# Altium schematic sheet TOP.SchDoc
size A2; SheetNumber: 1; SheetTotal: 18
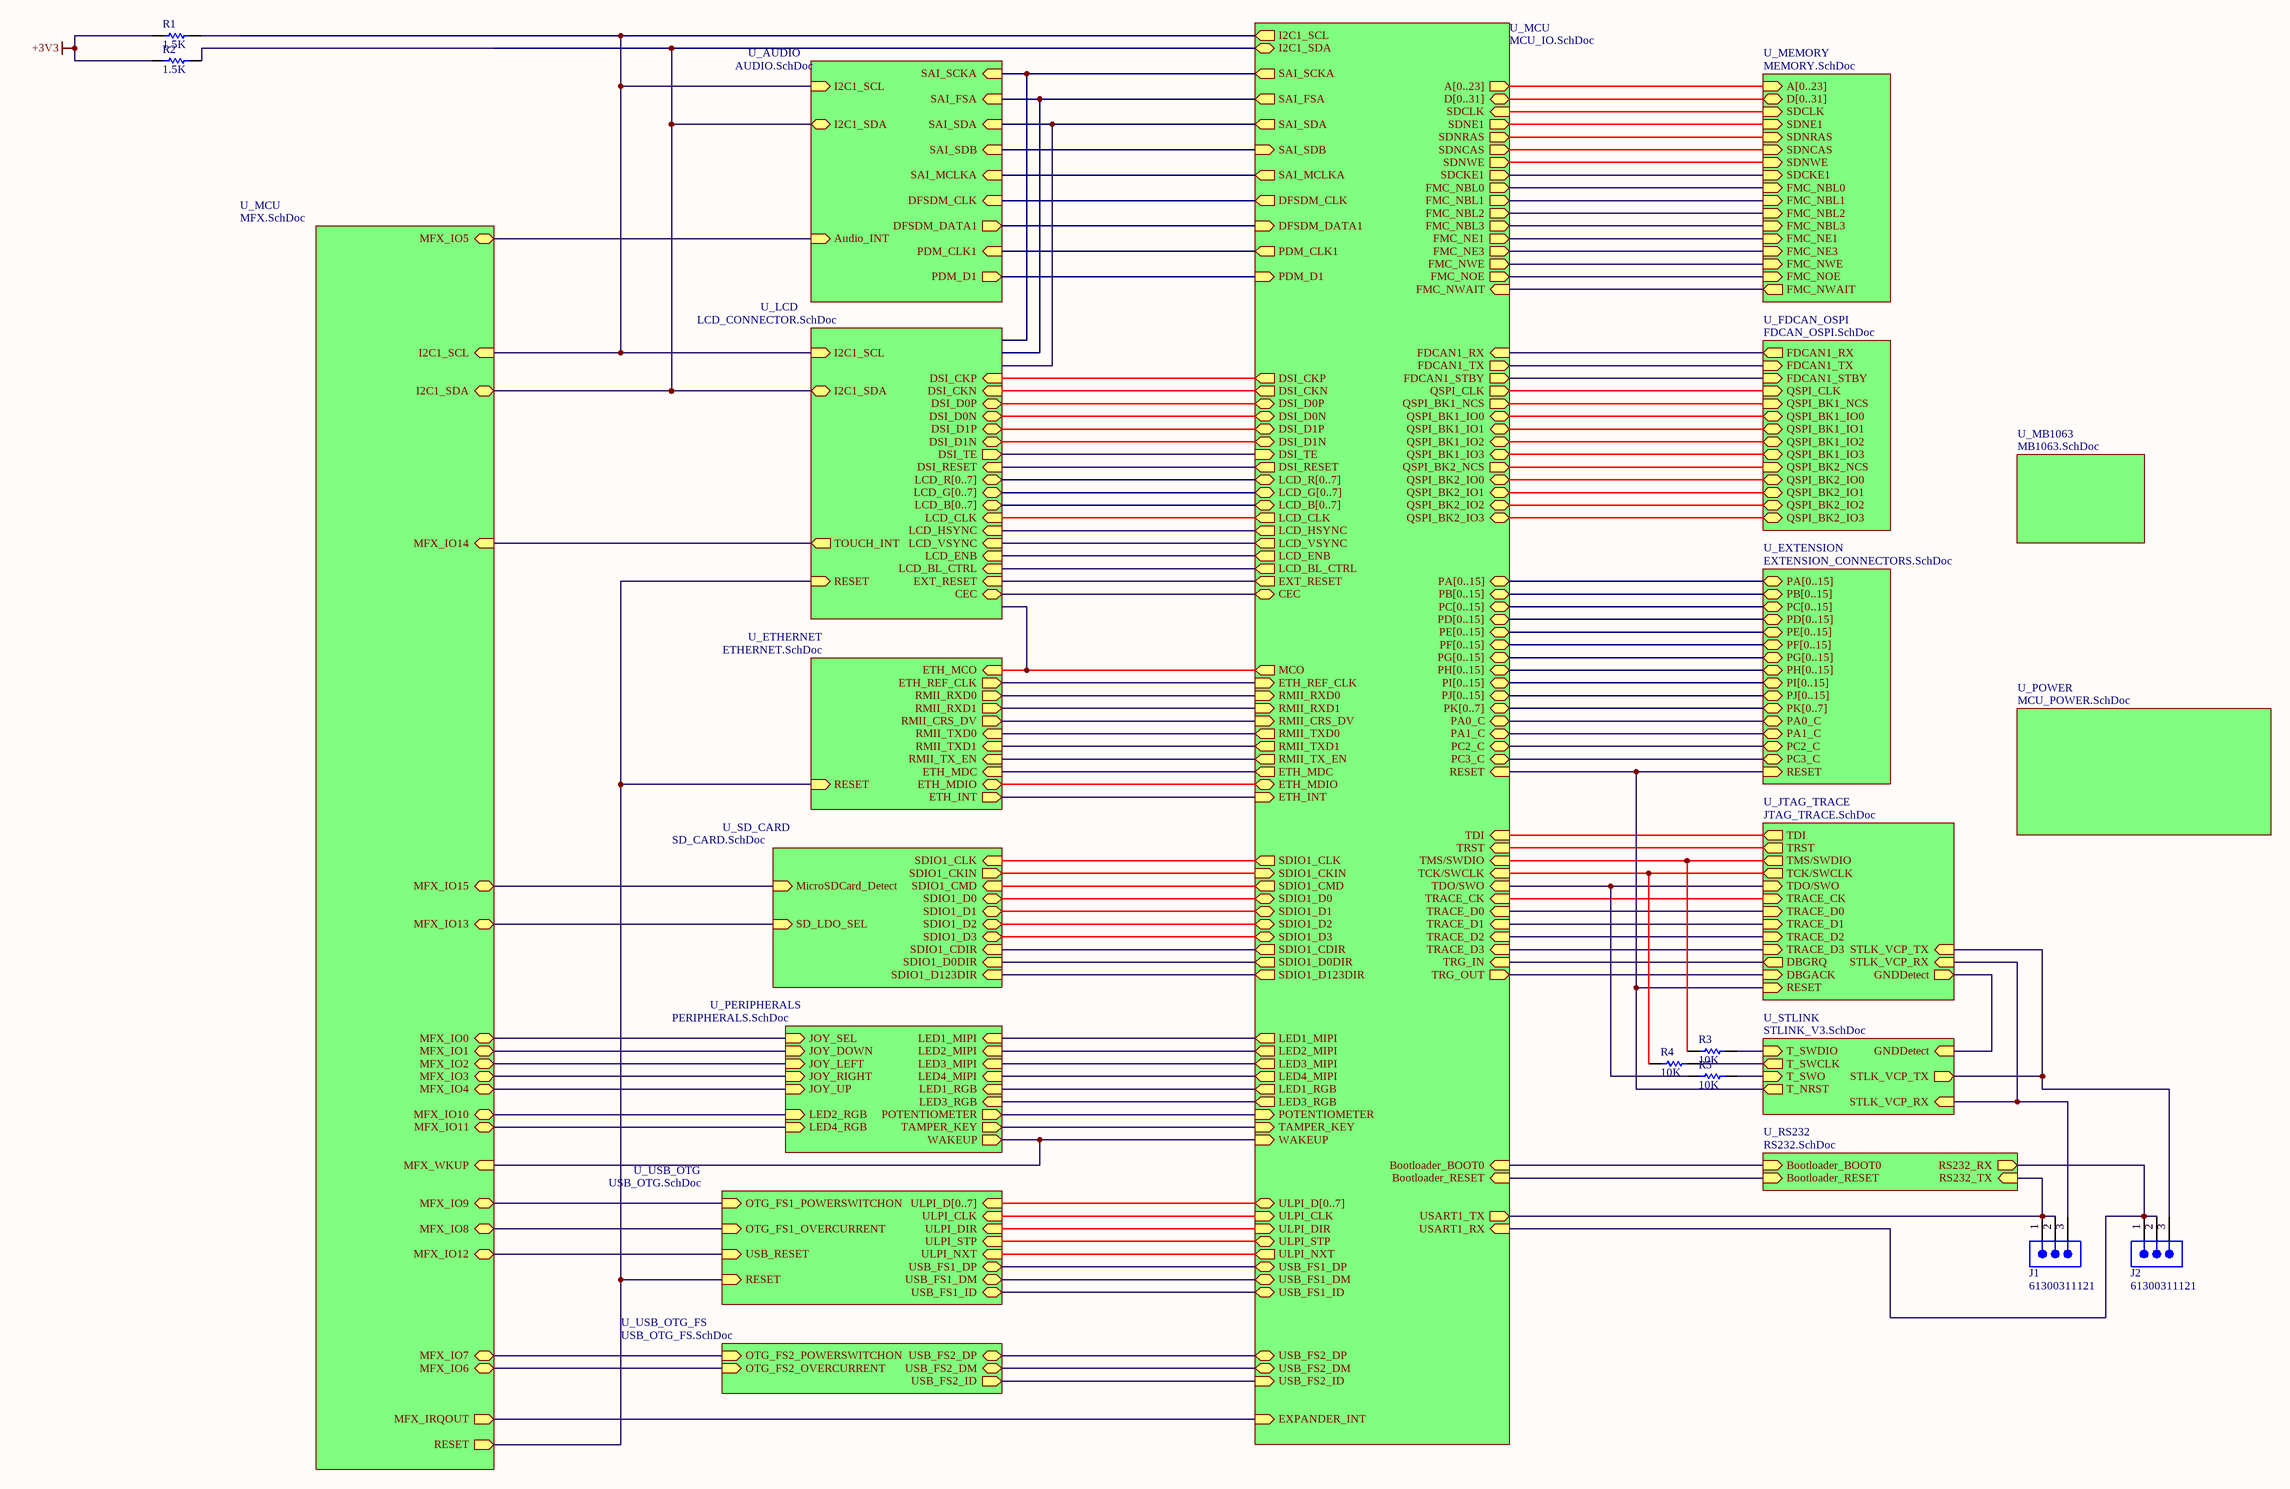
[diagram p0: TOP.SchDoc]

## Parts
J1  61300311121  [61300311121]
J2  61300311121  [61300311121]
R1  1.5K  [RESC1608X55X25NL10T15]
R2  1.5K  [RESC1608X55X25NL10T15]
R3  10K  [RESC1608X55X25NL10T15]
R4  10K  [RESC1608X55X25NL10T15]
R5  10K  [RESC1608X55X25NL10T15]

## Sub-sheets
U_AUDIO = AUDIO.SchDoc: Audio_INT (in), I2C1_SCL (in), I2C1_SDA (bidir), SAI_FSA (in), PDM_D1 (out), PDM_CLK1 (in), DFSDM_DATA1 (out), DFSDM_CLK (in), SAI_MCLKA (in), SAI_SDB (in), SAI_SDA (in), SAI_SCKA (in)
U_ETHERNET = ETHERNET.SchDoc: ETH_MCO (in), ETH_REF_CLK (out), RMII_RXD0 (out), RMII_RXD1 (out), RMII_CRS_DV (out), RMII_TXD1 (in), RMII_TX_EN (in), ETH_MDC (in), ETH_MDIO (bidir), ETH_INT (out), RESET (in), RMII_TXD0 (in)
U_EXTENSION = EXTENSION_CONNECTORS.SchDoc: PA[0..15] (bidir), PB[0..15] (bidir), PC[0..15] (bidir), PD[0..15] (bidir), PE[0..15] (bidir), PF[0..15] (bidir), PG[0..15] (bidir), PH[0..15] (bidir), PI[0..15] (bidir), PJ[0..15] (bidir), PK[0..7] (bidir), PA0_C (bidir), PA1_C (bidir), PC2_C (bidir), PC3_C (bidir), RESET (in)
U_FDCAN_OSPI = FDCAN_OSPI.SchDoc: FDCAN1_RX (out), FDCAN1_TX (in), FDCAN1_STBY (in), QSPI_CLK (in), QSPI_BK1_NCS (in), QSPI_BK1_IO0 (bidir), QSPI_BK1_IO1 (bidir), QSPI_BK1_IO2 (bidir), QSPI_BK1_IO3 (bidir), QSPI_BK2_NCS (in), QSPI_BK2_IO0 (bidir), QSPI_BK2_IO1 (bidir), QSPI_BK2_IO2 (bidir), QSPI_BK2_IO3 (bidir)
U_JTAG_TRACE = JTAG_TRACE.SchDoc: TDI (out), TRST (out), TMS/SWDIO (out), TCK/SWCLK (out), TDO/SWO (in), TRACE_CK (in), TRACE_D0 (in), TRACE_D1 (in), TRACE_D2 (in), TRACE_D3 (in), DBGRQ (out), DBGACK (in), RESET (in), STLK_VCP_TX (in), STLK_VCP_RX (in), GNDDetect (out)
U_LCD = LCD_CONNECTOR.SchDoc: I2C1_SCL (in), I2C1_SDA (bidir), LCD_R[0..7] (bidir), LCD_G[0..7] (bidir), LCD_B[0..7] (bidir), LCD_CLK (in), LCD_HSYNC (in), LCD_VSYNC (in), LCD_ENB (in), EXT_RESET (in), RESET (in), TOUCH_INT (out), LCD_BL_CTRL (in), DSI_CKP (in), DSI_CKN (in), DSI_D0P (bidir), DSI_D0N (bidir), DSI_D1P (bidir), DSI_D1N (bidir), CEC (bidir), DSI_RESET (in), DSI_TE (out)
U_MB1063 = MB1063.SchDoc: no entries
U_MCU = MFX.SchDoc: MFX_IO5 (bidir), I2C1_SCL (in), I2C1_SDA (bidir), MFX_IO14 (in), MFX_IO15 (bidir), MFX_IO13 (bidir), MFX_IO0 (bidir), MFX_IO1 (bidir), MFX_IO2 (bidir), MFX_IO3 (bidir), MFX_IO4 (bidir), MFX_IO10 (bidir), MFX_IO11 (bidir), MFX_WKUP (in), MFX_IO9 (bidir), MFX_IO8 (bidir), MFX_IO12 (bidir), MFX_IO7 (bidir), MFX_IO6 (bidir), MFX_IRQOUT (out), RESET (out)
U_MCU = MCU_IO.SchDoc: SAI_MCLKA (out), PDM_D1 (in), PDM_CLK1 (out), DFSDM_DATA1 (in), DFSDM_CLK (out), I2C1_SCL (out), I2C1_SDA (bidir), SAI_SCKA (out), SAI_FSA (out), SAI_SDA (out), SAI_SDB (in), DSI_CKP (out), DSI_CKN (out), DSI_D0P (bidir), DSI_D0N (bidir), DSI_D1P (bidir), DSI_D1N (bidir), DSI_TE (in), DSI_RESET (out), LCD_R[0..7] (bidir), LCD_G[0..7] (bidir), LCD_B[0..7] (bidir), LCD_CLK (out), LCD_HSYNC (out), LCD_VSYNC (out), LCD_ENB (out), LCD_BL_CTRL (out), EXT_RESET (out), CEC (bidir), MCO (out), ETH_REF_CLK (in), RMII_RXD0 (in), RMII_RXD1 (in), RMII_CRS_DV (in), RMII_TXD1 (out), RMII_TX_EN (out), ETH_MDC (out), ETH_MDIO (bidir), ETH_INT (in), RMII_TXD0 (out), SDIO1_CLK (out), SDIO1_CKIN (in), SDIO1_CMD (out), SDIO1_D0 (bidir), SDIO1_D1 (bidir), SDIO1_D2 (bidir), SDIO1_D3 (bidir), SDIO1_CDIR (out), SDIO1_D0DIR (out), SDIO1_D123DIR (out), LED1_MIPI (out), LED2_MIPI (out), LED3_MIPI (out), LED4_MIPI (out), LED1_RGB (out), LED3_RGB (out), POTENTIOMETER (in), TAMPER_KEY (in), WAKEUP (in), ULPI_D[0..7] (bidir), ULPI_CLK (in), ULPI_DIR (in), ULPI_STP (bidir), ULPI_NXT (out), USB_FS1_DP (bidir), USB_FS1_DM (bidir), USB_FS1_ID (bidir), USB_FS2_DP (bidir), USB_FS2_DM (bidir), USB_FS2_ID (in), EXPANDER_INT (in), A[0..23] (out), D[0..31] (bidir), SDCLK (in), SDNE1 (out), SDNRAS (out), SDNCAS (out), SDNWE (out), SDCKE1 (out), FMC_NBL0 (out), FMC_NBL1 (out), FMC_NBL2 (out), FMC_NBL3 (out), FMC_NE1 (out), FMC_NE3 (out), FMC_NWE (out), FMC_NOE (out), FMC_NWAIT (in), FDCAN1_RX (in), FDCAN1_TX (out), FDCAN1_STBY (out), QSPI_CLK (out), QSPI_BK1_NCS (out), QSPI_BK1_IO0 (bidir), QSPI_BK1_IO1 (bidir), QSPI_BK1_IO2 (bidir), QSPI_BK1_IO3 (bidir), QSPI_BK2_NCS (out), QSPI_BK2_IO0 (bidir), QSPI_BK2_IO1 (bidir), QSPI_BK2_IO2 (bidir), QSPI_BK2_IO3 (bidir), PA[0..15] (bidir), PB[0..15] (bidir), PC[0..15] (bidir), PD[0..15] (bidir), PE[0..15] (bidir), PF[0..15] (bidir), PG[0..15] (bidir), PH[0..15] (bidir), PI[0..15] (bidir), PJ[0..15] (bidir), PK[0..7] (bidir), PA0_C (bidir), PA1_C (bidir), PC2_C (bidir), PC3_C (bidir), RESET (in), TDI (in), TRST (in), TMS/SWDIO (in), TCK/SWCLK (in), TDO/SWO (in), TRACE_CK (in), TRACE_D0 (in), TRACE_D1 (in), TRACE_D2 (in), TRACE_D3 (in), TRG_IN (in), TRG_OUT (out), Bootloader_BOOT0 (in), Bootloader_RESET (in), USART1_TX (out), USART1_RX (in)
U_MEMORY = MEMORY.SchDoc: A[0..23] (in), D[0..31] (bidir), SDCLK (in), SDNE1 (in), SDNRAS (in), SDNCAS (in), SDNWE (in), SDCKE1 (in), FMC_NBL0 (in), FMC_NBL1 (in), FMC_NBL2 (in), FMC_NBL3 (in), FMC_NE1 (in), FMC_NE3 (in), FMC_NWE (in), FMC_NOE (in), FMC_NWAIT (out)
U_PERIPHERALS = PERIPHERALS.SchDoc: JOY_SEL (in), JOY_DOWN (in), JOY_LEFT (in), JOY_RIGHT (in), JOY_UP (in), LED2_RGB (in), LED4_RGB (in), LED1_MIPI (in), LED2_MIPI (in), LED3_MIPI (in), LED4_MIPI (in), LED1_RGB (in), LED3_RGB (in), POTENTIOMETER (out), TAMPER_KEY (out), WAKEUP (out)
U_POWER = MCU_POWER.SchDoc: no entries
U_RS232 = RS232.SchDoc: Bootloader_BOOT0 (in), Bootloader_RESET (in), RS232_RX (out), RS232_TX (in)
U_SD_CARD = SD_CARD.SchDoc: MicroSDCard_Detect (in), SD_LDO_SEL (in), SDIO1_CLK (in), SDIO1_CKIN (out), SDIO1_CMD (in), SDIO1_D0 (bidir), SDIO1_D1 (bidir), SDIO1_D2 (bidir), SDIO1_D3 (bidir), SDIO1_CDIR (in), SDIO1_D0DIR (in), SDIO1_D123DIR (in)
U_STLINK = STLINK_V3.SchDoc: T_SWDIO (in), T_SWCLK (out), T_SWO (in), T_NRST (out), GNDDetect (in), STLK_VCP_TX (out), STLK_VCP_RX (in)
U_USB_OTG = USB_OTG.SchDoc: OTG_FS1_POWERSWITCHON (in), OTG_FS1_OVERCURRENT (in), USB_RESET (in), RESET (in), ULPI_D[0..7] (in), ULPI_CLK (in), ULPI_DIR (in), ULPI_STP (in), ULPI_NXT (in), USB_FS1_DP (bidir), USB_FS1_DM (bidir), USB_FS1_ID (bidir)
U_USB_OTG_FS = USB_OTG_FS.SchDoc: USB_FS2_DP (bidir), USB_FS2_DM (bidir), USB_FS2_ID (out), OTG_FS2_POWERSWITCHON (in), OTG_FS2_OVERCURRENT (in)

## Nets
+3V3: R1.1 R2.1
NetJ1_1: J1.1 J1.2 ; sheet U_MCU/USART1_TX, sheet U_RS232/RS232_TX
NetJ1_3: J1.3 ; sheet U_JTAG_TRACE/STLK_VCP_RX, sheet U_STLINK/STLK_VCP_RX
NetJ2_1: J2.1 J2.2 ; sheet U_MCU/USART1_RX, sheet U_RS232/RS232_RX
NetJ2_3: J2.3 ; sheet U_JTAG_TRACE/STLK_VCP_TX, sheet U_STLINK/STLK_VCP_TX
NetR1_2: R1.2 ; sheet U_MCU/I2C1_SCL, sheet U_MCU/I2C1_SCL, sheet U_AUDIO/I2C1_SCL, sheet U_LCD/I2C1_SCL
NetR2_2: R2.2 ; sheet U_MCU/I2C1_SDA, sheet U_MCU/I2C1_SDA, sheet U_AUDIO/I2C1_SDA, sheet U_LCD/I2C1_SDA
NetR3_1: R3.1 ; sheet U_MCU/TMS/SWDIO, sheet U_JTAG_TRACE/TMS/SWDIO
NetR3_2: R3.2 ; sheet U_STLINK/T_SWDIO
NetR4_1: R4.1 ; sheet U_MCU/TCK/SWCLK, sheet U_JTAG_TRACE/TCK/SWCLK
NetR4_2: R4.2 ; sheet U_STLINK/T_SWCLK
NetR5_1: R5.1 ; sheet U_MCU/TDO/SWO, sheet U_JTAG_TRACE/TDO/SWO
NetR5_2: R5.2 ; sheet U_STLINK/T_SWO
(unnamed): sheet U_MCU/MFX_IO5, sheet U_AUDIO/Audio_INT
(unnamed): sheet U_MCU/MFX_IO14, sheet U_LCD/TOUCH_INT
(unnamed): sheet U_MCU/MFX_IO15, sheet U_SD_CARD/MicroSDCard_Detect
(unnamed): sheet U_MCU/MFX_IO13, sheet U_SD_CARD/SD_LDO_SEL
(unnamed): sheet U_MCU/MFX_IO0, sheet U_PERIPHERALS/JOY_SEL
(unnamed): sheet U_MCU/MFX_IO1, sheet U_PERIPHERALS/JOY_DOWN
(unnamed): sheet U_MCU/MFX_IO2, sheet U_PERIPHERALS/JOY_LEFT
(unnamed): sheet U_MCU/MFX_IO3, sheet U_PERIPHERALS/JOY_RIGHT
(unnamed): sheet U_MCU/MFX_IO4, sheet U_PERIPHERALS/JOY_UP
(unnamed): sheet U_MCU/MFX_IO10, sheet U_PERIPHERALS/LED2_RGB
(unnamed): sheet U_MCU/MFX_IO11, sheet U_PERIPHERALS/LED4_RGB
(unnamed): sheet U_MCU/MFX_WKUP, sheet U_MCU/WAKEUP, sheet U_PERIPHERALS/WAKEUP
(unnamed): sheet U_MCU/MFX_IO9, sheet U_USB_OTG/OTG_FS1_POWERSWITCHON
(unnamed): sheet U_MCU/MFX_IO8, sheet U_USB_OTG/OTG_FS1_OVERCURRENT
(unnamed): sheet U_MCU/MFX_IO12, sheet U_USB_OTG/USB_RESET
(unnamed): sheet U_MCU/MFX_IO7, sheet U_USB_OTG_FS/OTG_FS2_POWERSWITCHON
(unnamed): sheet U_MCU/MFX_IO6, sheet U_USB_OTG_FS/OTG_FS2_OVERCURRENT
(unnamed): sheet U_MCU/MFX_IRQOUT, sheet U_MCU/EXPANDER_INT
(unnamed): sheet U_MCU/RESET, sheet U_LCD/RESET, sheet U_ETHERNET/RESET, sheet U_USB_OTG/RESET
(unnamed): sheet U_MCU/SAI_MCLKA, sheet U_AUDIO/SAI_MCLKA
(unnamed): sheet U_MCU/PDM_D1, sheet U_AUDIO/PDM_D1
(unnamed): sheet U_MCU/PDM_CLK1, sheet U_AUDIO/PDM_CLK1
(unnamed): sheet U_MCU/DFSDM_DATA1, sheet U_AUDIO/DFSDM_DATA1
(unnamed): sheet U_MCU/DFSDM_CLK, sheet U_AUDIO/DFSDM_CLK
(unnamed): sheet U_MCU/SAI_SCKA, sheet U_AUDIO/SAI_SCKA
(unnamed): sheet U_MCU/SAI_FSA, sheet U_AUDIO/SAI_FSA
(unnamed): sheet U_MCU/SAI_SDA, sheet U_AUDIO/SAI_SDA
(unnamed): sheet U_MCU/SAI_SDB, sheet U_AUDIO/SAI_SDB
(unnamed): sheet U_MCU/DSI_CKP, sheet U_LCD/DSI_CKP
(unnamed): sheet U_MCU/DSI_CKN, sheet U_LCD/DSI_CKN
(unnamed): sheet U_MCU/DSI_D0P, sheet U_LCD/DSI_D0P
(unnamed): sheet U_MCU/DSI_D0N, sheet U_LCD/DSI_D0N
(unnamed): sheet U_MCU/DSI_D1P, sheet U_LCD/DSI_D1P
(unnamed): sheet U_MCU/DSI_D1N, sheet U_LCD/DSI_D1N
(unnamed): sheet U_MCU/DSI_TE, sheet U_LCD/DSI_TE
(unnamed): sheet U_MCU/DSI_RESET, sheet U_LCD/DSI_RESET
(unnamed): sheet U_MCU/LCD_CLK, sheet U_LCD/LCD_CLK
(unnamed): sheet U_MCU/LCD_HSYNC, sheet U_LCD/LCD_HSYNC
(unnamed): sheet U_MCU/LCD_VSYNC, sheet U_LCD/LCD_VSYNC
(unnamed): sheet U_MCU/LCD_ENB, sheet U_LCD/LCD_ENB
(unnamed): sheet U_MCU/LCD_BL_CTRL, sheet U_LCD/LCD_BL_CTRL
(unnamed): sheet U_MCU/EXT_RESET, sheet U_LCD/EXT_RESET
(unnamed): sheet U_MCU/CEC, sheet U_LCD/CEC
(unnamed): sheet U_MCU/MCO, sheet U_ETHERNET/ETH_MCO
(unnamed): sheet U_MCU/ETH_REF_CLK, sheet U_ETHERNET/ETH_REF_CLK
(unnamed): sheet U_MCU/RMII_RXD0, sheet U_ETHERNET/RMII_RXD0
(unnamed): sheet U_MCU/RMII_RXD1, sheet U_ETHERNET/RMII_RXD1
(unnamed): sheet U_MCU/RMII_CRS_DV, sheet U_ETHERNET/RMII_CRS_DV
(unnamed): sheet U_MCU/RMII_TXD1, sheet U_ETHERNET/RMII_TXD1
(unnamed): sheet U_MCU/RMII_TX_EN, sheet U_ETHERNET/RMII_TX_EN
(unnamed): sheet U_MCU/ETH_MDC, sheet U_ETHERNET/ETH_MDC
(unnamed): sheet U_MCU/ETH_MDIO, sheet U_ETHERNET/ETH_MDIO
(unnamed): sheet U_MCU/ETH_INT, sheet U_ETHERNET/ETH_INT
(unnamed): sheet U_MCU/RMII_TXD0, sheet U_ETHERNET/RMII_TXD0
(unnamed): sheet U_MCU/SDIO1_CLK, sheet U_SD_CARD/SDIO1_CLK
(unnamed): sheet U_MCU/SDIO1_CKIN, sheet U_SD_CARD/SDIO1_CKIN
(unnamed): sheet U_MCU/SDIO1_CMD, sheet U_SD_CARD/SDIO1_CMD
(unnamed): sheet U_MCU/SDIO1_D0, sheet U_SD_CARD/SDIO1_D0
(unnamed): sheet U_MCU/SDIO1_D1, sheet U_SD_CARD/SDIO1_D1
(unnamed): sheet U_MCU/SDIO1_D2, sheet U_SD_CARD/SDIO1_D2
(unnamed): sheet U_MCU/SDIO1_D3, sheet U_SD_CARD/SDIO1_D3
(unnamed): sheet U_MCU/SDIO1_CDIR, sheet U_SD_CARD/SDIO1_CDIR
(unnamed): sheet U_MCU/SDIO1_D0DIR, sheet U_SD_CARD/SDIO1_D0DIR
(unnamed): sheet U_MCU/SDIO1_D123DIR, sheet U_SD_CARD/SDIO1_D123DIR
(unnamed): sheet U_MCU/LED1_MIPI, sheet U_PERIPHERALS/LED1_MIPI
(unnamed): sheet U_MCU/LED2_MIPI, sheet U_PERIPHERALS/LED2_MIPI
(unnamed): sheet U_MCU/LED3_MIPI, sheet U_PERIPHERALS/LED3_MIPI
(unnamed): sheet U_MCU/LED4_MIPI, sheet U_PERIPHERALS/LED4_MIPI
(unnamed): sheet U_MCU/LED1_RGB, sheet U_PERIPHERALS/LED1_RGB
(unnamed): sheet U_MCU/LED3_RGB, sheet U_PERIPHERALS/LED3_RGB
(unnamed): sheet U_MCU/POTENTIOMETER, sheet U_PERIPHERALS/POTENTIOMETER
(unnamed): sheet U_MCU/TAMPER_KEY, sheet U_PERIPHERALS/TAMPER_KEY
(unnamed): sheet U_MCU/ULPI_CLK, sheet U_USB_OTG/ULPI_CLK
(unnamed): sheet U_MCU/ULPI_DIR, sheet U_USB_OTG/ULPI_DIR
(unnamed): sheet U_MCU/ULPI_STP, sheet U_USB_OTG/ULPI_STP
(unnamed): sheet U_MCU/ULPI_NXT, sheet U_USB_OTG/ULPI_NXT
(unnamed): sheet U_MCU/USB_FS1_DP, sheet U_USB_OTG/USB_FS1_DP
(unnamed): sheet U_MCU/USB_FS1_DM, sheet U_USB_OTG/USB_FS1_DM
(unnamed): sheet U_MCU/USB_FS1_ID, sheet U_USB_OTG/USB_FS1_ID
(unnamed): sheet U_MCU/USB_FS2_DP, sheet U_USB_OTG_FS/USB_FS2_DP
(unnamed): sheet U_MCU/USB_FS2_DM, sheet U_USB_OTG_FS/USB_FS2_DM
(unnamed): sheet U_MCU/USB_FS2_ID, sheet U_USB_OTG_FS/USB_FS2_ID
(unnamed): sheet U_MCU/SDCLK, sheet U_MEMORY/SDCLK
(unnamed): sheet U_MCU/SDNE1, sheet U_MEMORY/SDNE1
(unnamed): sheet U_MCU/SDNRAS, sheet U_MEMORY/SDNRAS
(unnamed): sheet U_MCU/SDNCAS, sheet U_MEMORY/SDNCAS
(unnamed): sheet U_MCU/SDNWE, sheet U_MEMORY/SDNWE
(unnamed): sheet U_MCU/SDCKE1, sheet U_MEMORY/SDCKE1
(unnamed): sheet U_MCU/FMC_NBL0, sheet U_MEMORY/FMC_NBL0
(unnamed): sheet U_MCU/FMC_NBL1, sheet U_MEMORY/FMC_NBL1
(unnamed): sheet U_MCU/FMC_NBL2, sheet U_MEMORY/FMC_NBL2
(unnamed): sheet U_MCU/FMC_NBL3, sheet U_MEMORY/FMC_NBL3
(unnamed): sheet U_MCU/FMC_NE1, sheet U_MEMORY/FMC_NE1
(unnamed): sheet U_MCU/FMC_NE3, sheet U_MEMORY/FMC_NE3
(unnamed): sheet U_MCU/FMC_NWE, sheet U_MEMORY/FMC_NWE
(unnamed): sheet U_MCU/FMC_NOE, sheet U_MEMORY/FMC_NOE
(unnamed): sheet U_MCU/FMC_NWAIT, sheet U_MEMORY/FMC_NWAIT
(unnamed): sheet U_MCU/FDCAN1_RX, sheet U_FDCAN_OSPI/FDCAN1_RX
(unnamed): sheet U_MCU/FDCAN1_TX, sheet U_FDCAN_OSPI/FDCAN1_TX
(unnamed): sheet U_MCU/FDCAN1_STBY, sheet U_FDCAN_OSPI/FDCAN1_STBY
(unnamed): sheet U_MCU/QSPI_CLK, sheet U_FDCAN_OSPI/QSPI_CLK
(unnamed): sheet U_MCU/QSPI_BK1_NCS, sheet U_FDCAN_OSPI/QSPI_BK1_NCS
(unnamed): sheet U_MCU/QSPI_BK1_IO0, sheet U_FDCAN_OSPI/QSPI_BK1_IO0
(unnamed): sheet U_MCU/QSPI_BK1_IO1, sheet U_FDCAN_OSPI/QSPI_BK1_IO1
(unnamed): sheet U_MCU/QSPI_BK1_IO2, sheet U_FDCAN_OSPI/QSPI_BK1_IO2
(unnamed): sheet U_MCU/QSPI_BK1_IO3, sheet U_FDCAN_OSPI/QSPI_BK1_IO3
(unnamed): sheet U_MCU/QSPI_BK2_NCS, sheet U_FDCAN_OSPI/QSPI_BK2_NCS
(unnamed): sheet U_MCU/QSPI_BK2_IO0, sheet U_FDCAN_OSPI/QSPI_BK2_IO0
(unnamed): sheet U_MCU/QSPI_BK2_IO1, sheet U_FDCAN_OSPI/QSPI_BK2_IO1
(unnamed): sheet U_MCU/QSPI_BK2_IO2, sheet U_FDCAN_OSPI/QSPI_BK2_IO2
(unnamed): sheet U_MCU/QSPI_BK2_IO3, sheet U_FDCAN_OSPI/QSPI_BK2_IO3
(unnamed): sheet U_MCU/PA0_C, sheet U_EXTENSION/PA0_C
(unnamed): sheet U_MCU/PA1_C, sheet U_EXTENSION/PA1_C
(unnamed): sheet U_MCU/PC2_C, sheet U_EXTENSION/PC2_C
(unnamed): sheet U_MCU/PC3_C, sheet U_EXTENSION/PC3_C
(unnamed): sheet U_MCU/RESET, sheet U_EXTENSION/RESET, sheet U_JTAG_TRACE/RESET, sheet U_STLINK/T_NRST
(unnamed): sheet U_MCU/TDI, sheet U_JTAG_TRACE/TDI
(unnamed): sheet U_MCU/TRST, sheet U_JTAG_TRACE/TRST
(unnamed): sheet U_MCU/TRACE_CK, sheet U_JTAG_TRACE/TRACE_CK
(unnamed): sheet U_MCU/TRACE_D0, sheet U_JTAG_TRACE/TRACE_D0
(unnamed): sheet U_MCU/TRACE_D1, sheet U_JTAG_TRACE/TRACE_D1
(unnamed): sheet U_MCU/TRACE_D2, sheet U_JTAG_TRACE/TRACE_D2
(unnamed): sheet U_MCU/TRACE_D3, sheet U_JTAG_TRACE/TRACE_D3
(unnamed): sheet U_MCU/TRG_IN, sheet U_JTAG_TRACE/DBGRQ
(unnamed): sheet U_MCU/TRG_OUT, sheet U_JTAG_TRACE/DBGACK
(unnamed): sheet U_MCU/Bootloader_BOOT0, sheet U_RS232/Bootloader_BOOT0
(unnamed): sheet U_MCU/Bootloader_RESET, sheet U_RS232/Bootloader_RESET
(unnamed): sheet U_JTAG_TRACE/GNDDetect, sheet U_STLINK/GNDDetect

## Buses and harness runs
bus sheet U_EXTENSION/PA[0..15] = sheet U_MCU/PA[0..15]
bus sheet U_EXTENSION/PB[0..15] = sheet U_MCU/PB[0..15]
bus sheet U_EXTENSION/PC[0..15] = sheet U_MCU/PC[0..15]
bus sheet U_EXTENSION/PD[0..15] = sheet U_MCU/PD[0..15]
bus sheet U_EXTENSION/PE[0..15] = sheet U_MCU/PE[0..15]
bus sheet U_EXTENSION/PF[0..15] = sheet U_MCU/PF[0..15]
bus sheet U_EXTENSION/PG[0..15] = sheet U_MCU/PG[0..15]
bus sheet U_EXTENSION/PH[0..15] = sheet U_MCU/PH[0..15]
bus sheet U_EXTENSION/PI[0..15] = sheet U_MCU/PI[0..15]
bus sheet U_EXTENSION/PJ[0..15] = sheet U_MCU/PJ[0..15]
bus sheet U_EXTENSION/PK[0..7] = sheet U_MCU/PK[0..7]
bus sheet U_LCD/LCD_B[0..7] = sheet U_MCU/LCD_B[0..7]
bus sheet U_LCD/LCD_G[0..7] = sheet U_MCU/LCD_G[0..7]
bus sheet U_LCD/LCD_R[0..7] = sheet U_MCU/LCD_R[0..7]
bus sheet U_MCU/A[0..23] = sheet U_MEMORY/A[0..23]
bus sheet U_MCU/D[0..31] = sheet U_MEMORY/D[0..31]
bus sheet U_MCU/ULPI_D[0..7] = sheet U_USB_OTG/ULPI_D[0..7]

## Library data of the parts
J1 J2 = 61300311121: WR-PHD Straight Male, PCB Header, Through Hole, 1 Rows, 3 Contacts, 2.54mm Pitch; Manufacturer: Wurth Elektronik; Manufacturer Lifecycle Status: ACTIVE; Connector Type: Male Pin; Contact Resistance: 20mΩ; Current Rating: 3A; Insulation Resistance: 1GΩ; Number of Contacts: 3; Operating Supply Voltage: 250V; YEOL: 1 = Estimated lifetime > 10 years; Supplier: DigiKey; Supplier Part Number: 732-5316-ND; Manufacturer Part Number: 61300311121; RoHS: Compliant; Category: Headers and Wire Housings; Stock: 188859; Pricing: 1=0.13, 10=0.113, 25=0.094, 50=0.0798 (USD); Color: Black; Contact Material: Gold; Contact Mating Length: 5.9944mm; Contact Plating: Gold; Gender: Male; Height: 8.94mm; Lead Free: Lead Free; Lead Pitch: 2.54mm; Length: 7.62mm; Lifecycle Status: Production; Max Operating Temperature: 105°C; Min Operating Temperature: -40°C; Mounting Technology: Through Hole; Pins: 3; Number of Positions: 3; Number of Rows: 1; Orientation: Vertical; Packaging: Bulk; Pitch: 2.54mm; Termination: Solder; Voltage Rating: 250V; ComponentLink1URL: https://datasheet.octopart.com:443/61300311121-Wurth-Elektronik-datasheet-168684096.pdf?src-supplier=Wurth+Elektronik; ComponentLink1Description: https://datasheet.octopart.com:443/61300311121-Wurth-Elektronik-datasheet-168684096.pdf?src-supplier=Wurth+Elektronik; ComponentLink2URL: https://datasheet.octopart.com:443/61300311121-W%C3%BCrth-Elektronik-datasheet-44382959.pdf?src-supplier=Future+Electronics; ComponentLink2Description: https://datasheet.octopart.com:443/61300311121-W%C3%BCrth-Elektronik-datasheet-44382959.pdf?src-supplier=Future+Electronics; ComponentLink3URL: https://datasheet.octopart.com:443/61300311121-W%C3%BCrth-Elektronik-datasheet-149524047.pdf?src-supplier=Farnell; ComponentLink3Description: https://datasheet.octopart.com:443/61300311121-W%C3%BCrth-Elektronik-datasheet-149524047.pdf?src-supplier=Farnell; ComponentLink4URL: https://datasheet.octopart.com:443/61300311121-W%C3%BCrth-Elektronik-datasheet-21154836.pdf?src-supplier=element14+APAC; ComponentLink4Description: https://datasheet.octopart.com:443/61300311121-W%C3%BCrth-Elektronik-datasheet-21154836.pdf?src-supplier=element14+APAC; ComponentLink5URL: https://datasheet.octopart.com/613-003-111-21-W%C3%BCrth-Elektronik-datasheet-134615323.pdf; ComponentLink5Description: https://datasheet.octopart.com/613-003-111-21-W%C3%BCrth-Elektronik-datasheet-134615323.pdf
R1 R2 = RC0603FR-071K5L: 100mW Thick Film Resistors 75V ±100ppm/℃ ±1% 1.5kΩ 0603 Chip Resistor - Surface Mount ROHS; Manufacturer: Yageo Group; Temperature Coefficient: 100ppm/°C; Voltage Rating (AC): 50V; Supplier: DigiKey; Supplier Part Number: 311-1.50KHRDKR-ND; Manufacturer Part Number: RC0603FR-071K5L; RoHS: Compliant; Category: Chip SMD Resistors; Stock: 1165040; Pricing: 1=0.11, 10=0.027, 25=0.0196, 50=0.0158, 100=0.0129, 250=0.00996, 500=0.0083, 1000=0.00701 (USD); Case/Package: 0603; Case Code (Imperial): 0603; China RoHS: Non-Compliant; Composition: Thick Film; Contact Plating: Tin; Depth: 800µm; Features: Moisture Resistant; Height: 450µm; Lead Free: Lead Free; Length: 1.6mm; Lifecycle Status: Production; Max Operating Temperature: 155°C; Max Power Dissipation: 100mW; Military Standard: Not; Min Operating Temperature: -55°C; Mounting Technology: Surface Mount; Pins: 2; Number of Terminals: 2; Number of Terminations: 2; Packaging: Tape & Reel; Power Rating: 100mW; Radiation Hardening: No; REACH SVHC: Yes; Value: 1.5kΩ; Schedule B: 8533210045, 8533210045|8533210045|8533210045|8533210045|8533210045|8533210045|8533210045|8533210045|8533210045|8533210045|8533210045|8533210045|8533210045|8533210045|8533210045|8533210045|8533210045|8533210045|8533210045|8533210045|8533210045|8533210045|8533210045|85; Termination: SMD/SMT; Tolerance: 1%; Voltage Rating: 75V; Voltage Rating (DC): 50V; Width: 800µm; Working Voltage: 75V; ComponentLink1URL: https://datasheet.octopart.com:443/RC0603FR-071K5L-Yageo-datasheet-175887523.pdf?src-supplier=IHS; ComponentLink1Description: https://datasheet.octopart.com:443/RC0603FR-071K5L-Yageo-datasheet-175887523.pdf?src-supplier=IHS; ComponentLink2URL: https://datasheet.octopart.com:443/RC0603FR-071K5L-Yageo-datasheet-8328172.pdf?src-supplier=Newark; ComponentLink2Description: https://datasheet.octopart.com:443/RC0603FR-071K5L-Yageo-datasheet-8328172.pdf?src-supplier=Newark; ComponentLink3URL: https://datasheet.octopart.com:443/RC0603FR-071K5L-Yageo-datasheet-34211833.pdf?src-supplier=Newark; ComponentLink3Description: https://datasheet.octopart.com:443/RC0603FR-071K5L-Yageo-datasheet-34211833.pdf?src-supplier=Newark; ComponentLink4URL: https://datasheet.octopart.com:443/RC0603FR-071K5L-Yageo-datasheet-103092701.pdf?src-supplier=Upverter; ComponentLink4Description: https://datasheet.octopart.com:443/RC0603FR-071K5L-Yageo-datasheet-103092701.pdf?src-supplier=Upverter; ComponentLink5URL: https://datasheet.octopart.com:443/RC0603FR-071K5L-Yageo-Group-datasheet-190305687.pdf?src-supplier=Future+Electronics; ComponentLink5Description: https://datasheet.octopart.com:443/RC0603FR-071K5L-Yageo-Group-datasheet-190305687.pdf?src-supplier=Future+Electronics; ComponentLink6URL: https://datasheet.octopart.com:443/RC0603FR-071K5L-Yageo-datasheet-12596169.pdf?src-supplier=Future+Electronics; ComponentLink6Description: https://datasheet.octopart.com:443/RC0603FR-071K5L-Yageo-datasheet-12596169.pdf?src-supplier=Future+Electronics; ComponentLink7URL: https://datasheet.octopart.com:443/RC0603FR-071K5L-Yageo-datasheet-164759695.pdf?src-supplier=Future+Electronics; ComponentLink7Description: https://datasheet.octopart.com:443/RC0603FR-071K5L-Yageo-datasheet-164759695.pdf?src-supplier=Future+Electronics; ComponentLink8URL: https://datasheet.octopart.com:443/RC0603FR-071K5L-Yageo-datasheet-137700087.pdf?src-supplier=Future+Electronics; ComponentLink8Description: https://datasheet.octopart.com:443/RC0603FR-071K5L-Yageo-datasheet-137700087.pdf?src-supplier=Future+Electronics; ComponentLink9URL: https://datasheet.octopart.com:443/RC0603FR-071K5L-Yageo-datasheet-127823281.pdf?src-supplier=Future+Electronics; ComponentLink9Description: https://datasheet.octopart.com:443/RC0603FR-071K5L-Yageo-datasheet-127823281.pdf?src-supplier=Future+Electronics; ComponentLink10URL: https://datasheet.octopart.com:443/RC0603FR071K5L-Yageo-datasheet-27584510.pdf?src-supplier=Future+Electronics; ComponentLink10Description: https://datasheet.octopart.com:443/RC0603FR071K5L-Yageo-datasheet-27584510.pdf?src-supplier=Future+Electronics; ComponentLink11URL: https://datasheet.octopart.com:443/RC0603FR-071K5L-Yageo-datasheet-15599030.pdf?src-supplier=Future+Electronics; ComponentLink11Description: https://datasheet.octopart.com:443/RC0603FR-071K5L-Yageo-datasheet-15599030.pdf?src-supplier=Future+Electronics; ComponentLink12URL: https://datasheet.octopart.com:443/RC0603FR-071K5L-Yageo-datasheet-8324193.pdf?src-supplier=Future+Electronics; ComponentLink12Description: https://datasheet.octopart.com:443/RC0603FR-071K5L-Yageo-datasheet-8324193.pdf?src-supplier=Future+Electronics; ComponentLink13URL: https://datasheet.octopart.com:443/RC0603FR-071K5L-Yageo-datasheet-62067350.pdf?src-supplier=element14+APAC; ComponentLink13Description: https://datasheet.octopart.com:443/RC0603FR-071K5L-Yageo-datasheet-62067350.pdf?src-supplier=element14+APAC; ComponentLink14URL: https://datasheet.octopart.com:443/RC0603FR-071K5L-Yageo-Group-datasheet-189192902.pdf?src-supplier=LCSC; ComponentLink14Description: https://datasheet.octopart.com:443/RC0603FR-071K5L-Yageo-Group-datasheet-189192902.pdf?src-supplier=LCSC; ComponentLink15URL: https://datasheet.octopart.com:443/RC0603FR-071K5L-Yageo-datasheet-79472498.pdf?src-supplier=Megastar; ComponentLink15Description: https://datasheet.octopart.com:443/RC0603FR-071K5L-Yageo-datasheet-79472498.pdf?src-supplier=Megastar; ComponentLink16URL: https://datasheet.octopart.com/RC0603FR-071K5L-Yageo-datasheet-73766026.pdf; ComponentLink16Description: https://datasheet.octopart.com/RC0603FR-071K5L-Yageo-datasheet-73766026.pdf; ComponentLink17URL: https://datasheet.octopart.com:443/RC0603FR-071K5L-Yageo-datasheet-30459151.pdf?src-supplier=Seeed+Studio; ComponentLink17Description: https://datasheet.octopart.com:443/RC0603FR-071K5L-Yageo-datasheet-30459151.pdf?src-supplier=Seeed+Studio; ComponentLink18URL: https://datasheet.octopart.com:443/RC0603FR-071K5L-Yageo-datasheet-13691069.pdf?src-supplier=Farnell; ComponentLink18Description: https://datasheet.octopart.com:443/RC0603FR-071K5L-Yageo-datasheet-13691069.pdf?src-supplier=Farnell; ComponentLink19URL: https://datasheet.octopart.com:443/RC0603FR-071K5L-Yageo-datasheet-118562.pdf?src-supplier=DigiKey; ComponentLink19Description: https://datasheet.octopart.com:443/RC0603FR-071K5L-Yageo-datasheet-118562.pdf?src-supplier=DigiKey; ComponentLink20URL: http://sigma.octopart.com:80/conflict_mineral_statement/Yageo-company-3.pdf?src-supplier=Compliance+Statements; ComponentLink20Description: http://sigma.octopart.com:80/conflict_mineral_statement/Yageo-company-3.pdf?src-supplier=Compliance+Statements; ComponentLink21URL: http://sigma.octopart.com:80/rohs_statement/Yageo-company-2.pdf?src-supplier=Compliance+Statements; ComponentLink21Description: http://sigma.octopart.com:80/rohs_statement/Yageo-company-2.pdf?src-supplier=Compliance+Statements
R3-R5 = RC0603FR-0710KL: 100mW Thick Film Resistors ±100ppm/℃ ±1% 10kΩ 0603 Chip Resistor - Surface Mount ROHS; Manufacturer: Yageo Group; Temperature Coefficient: 100ppm/°C; Voltage Rating: 75V; Voltage Rating (DC): 50V; Supplier: DigiKey; Supplier Part Number: 311-10.0KHRDKR-ND; Manufacturer Part Number: RC0603FR-0710KL; RoHS: Compliant; Category: Chip SMD Resistors; Stock: 778832; Pricing: 1=0.1, 10=0.025, 25=0.0188, 50=0.015, 100=0.0122, 250=0.0094, 500=0.00782, 1000=0.00661 (USD); Case/Package: 0603; Case Code (Imperial): 0603; Case Code (Metric): 0603; China RoHS: Non-Compliant; Composition: Thick Film; Contact Plating: Tin; Depth: 800µm; Height: 450µm; Lead Free: Lead Free; Lead Pitch: 300µm; Length: 1.6mm; Lifecycle Status: Production; Max Operating Temperature: 155°C; Military Standard: Not; Min Operating Temperature: -55°C; Mounting Technology: Surface Mount; Pins: 2; Number of Terminals: 2; Packaging: Tape & Reel; Power Rating: 100mW; Radiation Hardening: No; REACH SVHC: Yes; Value: 10kΩ; Schedule B: 8533210045, 8533210045|8533210045|8533210045|8533210045|8533210045|8533210045|8533210045|8533210045|8533210045|8533210045|8533210045|8533210045|8533210045|8533210045|8533210045|8533210045|8533210045|8533210045|8533210045|8533210045|8533210045|8533210045|8533210045|85; Termination: SMD/SMT; Tolerance: 1%; Weight: 2.012816mg; Width: 800µm; Working Voltage: 75V; ComponentLink1URL: https://datasheet.octopart.com:443/RC0603FR-0710KL-Yageo-datasheet-175887523.pdf?src-supplier=IHS; ComponentLink1Description: https://datasheet.octopart.com:443/RC0603FR-0710KL-Yageo-datasheet-175887523.pdf?src-supplier=IHS; ComponentLink2URL: https://datasheet.octopart.com:443/RC0603FR-0710KL-Yageo-datasheet-103092701.pdf?src-supplier=Upverter; ComponentLink2Description: https://datasheet.octopart.com:443/RC0603FR-0710KL-Yageo-datasheet-103092701.pdf?src-supplier=Upverter; ComponentLink3URL: https://datasheet.octopart.com:443/RC0603FR-0710KL-Yageo-datasheet-98239111.pdf?src-supplier=Upverter; ComponentLink3Description: https://datasheet.octopart.com:443/RC0603FR-0710KL-Yageo-datasheet-98239111.pdf?src-supplier=Upverter; ComponentLink4URL: https://datasheet.octopart.com:443/RC0603FR-0710KL-Yageo-datasheet-141265859.pdf?src-supplier=Upverter; ComponentLink4Description: https://datasheet.octopart.com:443/RC0603FR-0710KL-Yageo-datasheet-141265859.pdf?src-supplier=Upverter; ComponentLink5URL: https://sigma.octopart.com:443/138820526/technical_drawing/Yageo-RC0603FR-0710KL.pdf?src-supplier=Upverter; ComponentLink5Description: https://sigma.octopart.com:443/138820526/technical_drawing/Yageo-RC0603FR-0710KL.pdf?src-supplier=Upverter; ComponentLink6URL: https://datasheet.octopart.com:443/RC0603FR-0710KL-Yageo-datasheet-8328172.pdf?src-supplier=Farnell; ComponentLink6Description: https://datasheet.octopart.com:443/RC0603FR-0710KL-Yageo-datasheet-8328172.pdf?src-supplier=Farnell; ComponentLink7URL: https://datasheet.octopart.com:443/RC0603FR-0710KL-Yageo-datasheet-13691069.pdf?src-supplier=Farnell; ComponentLink7Description: https://datasheet.octopart.com:443/RC0603FR-0710KL-Yageo-datasheet-13691069.pdf?src-supplier=Farnell; ComponentLink8URL: https://datasheet.octopart.com:443/RC0603FR-0710KL-Yageo-datasheet-62067350.pdf?src-supplier=element14+APAC; ComponentLink8Description: https://datasheet.octopart.com:443/RC0603FR-0710KL-Yageo-datasheet-62067350.pdf?src-supplier=element14+APAC; ComponentLink9URL: https://datasheet.octopart.com:443/RC0603FR-0710KL-Yageo-datasheet-17842380.pdf?src-supplier=element14+APAC; ComponentLink9Description: https://datasheet.octopart.com:443/RC0603FR-0710KL-Yageo-datasheet-17842380.pdf?src-supplier=element14+APAC; ComponentLink10URL: https://datasheet.octopart.com:443/RC0603FR-0710KL-Yageo-datasheet-15599030.pdf?src-supplier=Future+Electronics; ComponentLink10Description: https://datasheet.octopart.com:443/RC0603FR-0710KL-Yageo-datasheet-15599030.pdf?src-supplier=Future+Electronics; ComponentLink11URL: https://datasheet.octopart.com:443/RC0603FR-0710KL-Yageo-Group-datasheet-176638170.pdf?src-supplier=Future+Electronics; ComponentLink11Description: https://datasheet.octopart.com:443/RC0603FR-0710KL-Yageo-Group-datasheet-176638170.pdf?src-supplier=Future+Electronics; ComponentLink12URL: https://datasheet.octopart.com:443/RC0603FR-0710KL-Yageo-datasheet-164759695.pdf?src-supplier=Future+Electronics; ComponentLink12Description: https://datasheet.octopart.com:443/RC0603FR-0710KL-Yageo-datasheet-164759695.pdf?src-supplier=Future+Electronics; ComponentLink13URL: https://datasheet.octopart.com:443/RC0603FR-0710KL-Yageo-datasheet-127823281.pdf?src-supplier=Future+Electronics; ComponentLink13Description: https://datasheet.octopart.com:443/RC0603FR-0710KL-Yageo-datasheet-127823281.pdf?src-supplier=Future+Electronics; ComponentLink14URL: https://datasheet.octopart.com:443/RC0603FR-0710KL-Yageo-datasheet-137700087.pdf?src-supplier=Future+Electronics; ComponentLink14Description: https://datasheet.octopart.com:443/RC0603FR-0710KL-Yageo-datasheet-137700087.pdf?src-supplier=Future+Electronics; ComponentLink15URL: https://datasheet.octopart.com:443/RC0603FR-0710KL-Yageo-datasheet-27584510.pdf?src-supplier=Future+Electronics; ComponentLink15Description: https://datasheet.octopart.com:443/RC0603FR-0710KL-Yageo-datasheet-27584510.pdf?src-supplier=Future+Electronics; ComponentLink16URL: https://datasheet.octopart.com:443/RC0603FR-0710KL-Yageo-datasheet-8324193.pdf?src-supplier=Future+Electronics; ComponentLink16Description: https://datasheet.octopart.com:443/RC0603FR-0710KL-Yageo-datasheet-8324193.pdf?src-supplier=Future+Electronics; ComponentLink17URL: https://datasheet.octopart.com:443/RC0603FR-0710KL-Yageo-datasheet-12596169.pdf?src-supplier=Newark; ComponentLink17Description: https://datasheet.octopart.com:443/RC0603FR-0710KL-Yageo-datasheet-12596169.pdf?src-supplier=Newark; ComponentLink18URL: https://datasheet.octopart.com:443/RC0603FR-0710KL-Yageo-datasheet-503470.pdf?src-supplier=Newark; ComponentLink18Description: https://datasheet.octopart.com:443/RC0603FR-0710KL-Yageo-datasheet-503470.pdf?src-supplier=Newark; ComponentLink19URL: https://datasheet.octopart.com:443/RC0603FR-0710KL-Yageo-datasheet-34211833.pdf?src-supplier=Newark; ComponentLink19Description: https://datasheet.octopart.com:443/RC0603FR-0710KL-Yageo-datasheet-34211833.pdf?src-supplier=Newark; ComponentLink20URL: https://datasheet.octopart.com:443/RC0603FR-0710KL-Yageo-Group-datasheet-189192902.pdf?src-supplier=LCSC; ComponentLink20Description: https://datasheet.octopart.com:443/RC0603FR-0710KL-Yageo-Group-datasheet-189192902.pdf?src-supplier=LCSC; ComponentLink21URL: https://datasheet.octopart.com:443/RC0603FR-0710KL-Yageo-datasheet-79472498.pdf?src-supplier=Megastar; ComponentLink21Description: https://datasheet.octopart.com:443/RC0603FR-0710KL-Yageo-datasheet-79472498.pdf?src-supplier=Megastar; ComponentLink22URL: https://datasheet.octopart.com/RC0603FR-0710KL-Yageo-datasheet-73766026.pdf; ComponentLink22Description: https://datasheet.octopart.com/RC0603FR-0710KL-Yageo-datasheet-73766026.pdf; ComponentLink23URL: https://datasheet.octopart.com:443/RC0603FR-0710KL-Yageo-datasheet-118562.pdf?src-supplier=DigiKey; ComponentLink23Description: https://datasheet.octopart.com:443/RC0603FR-0710KL-Yageo-datasheet-118562.pdf?src-supplier=DigiKey; ComponentLink24URL: http://sigma.octopart.com:80/conflict_mineral_statement/Yageo-company-3.pdf?src-supplier=Compliance+Statements; ComponentLink24Description: http://sigma.octopart.com:80/conflict_mineral_statement/Yageo-company-3.pdf?src-supplier=Compliance+Statements; ComponentLink25URL: http://sigma.octopart.com:80/rohs_statement/Yageo-company-2.pdf?src-supplier=Compliance+Statements; ComponentLink25Description: http://sigma.octopart.com:80/rohs_statement/Yageo-company-2.pdf?src-supplier=Compliance+Statements